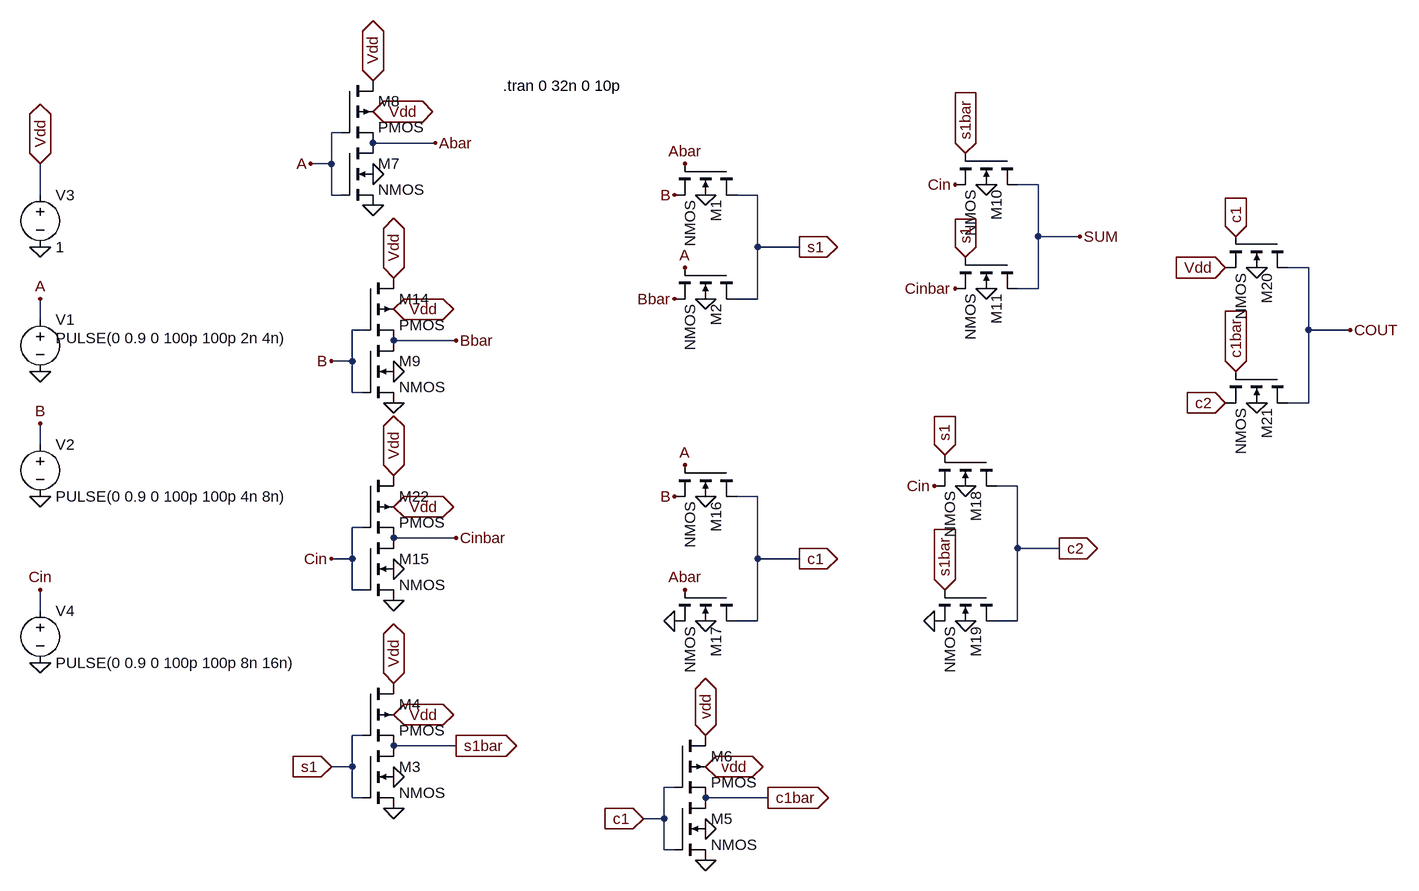
[diagram p0: schematic cmospasstran.asc]
cmospasstran.asc, the LTspice schematic file:
Version 4.1
SHEET 1 3336 932
WIRE 160 -368 144 -368
WIRE 304 -352 208 -352
WIRE 144 -320 144 -368
WIRE 144 -320 112 -320
WIRE 1232 -288 1200 -288
WIRE -304 -272 -304 -320
WIRE 144 -272 144 -320
WIRE 160 -272 144 -272
WIRE 800 -272 768 -272
WIRE 1232 -208 1232 -288
WIRE 1296 -208 1232 -208
WIRE 800 -192 800 -272
WIRE 864 -192 800 -192
WIRE 1648 -160 1616 -160
WIRE 1232 -128 1232 -208
WIRE 1232 -128 1200 -128
WIRE 800 -112 800 -192
WIRE 800 -112 768 -112
WIRE -304 -80 -304 -112
WIRE 192 -64 176 -64
WIRE 1648 -64 1648 -160
WIRE 1712 -64 1648 -64
WIRE 336 -48 240 -48
WIRE 176 -16 176 -64
WIRE 176 -16 144 -16
WIRE 176 32 176 -16
WIRE 192 32 176 32
WIRE 1648 48 1648 -64
WIRE 1648 48 1616 48
WIRE -304 112 -304 80
WIRE 1200 176 1168 176
WIRE 800 192 768 192
WIRE 192 240 176 240
WIRE 336 256 240 256
WIRE 1200 272 1200 176
WIRE 1264 272 1200 272
WIRE 176 288 176 240
WIRE 176 288 144 288
WIRE 800 288 800 192
WIRE 864 288 800 288
WIRE 176 336 176 288
WIRE 192 336 176 336
WIRE -304 368 -304 336
WIRE 800 384 800 288
WIRE 800 384 768 384
WIRE 1200 384 1200 272
WIRE 1200 384 1168 384
WIRE 192 560 176 560
WIRE 336 576 240 576
WIRE 176 608 176 560
WIRE 176 608 144 608
WIRE 672 640 656 640
WIRE 176 656 176 608
WIRE 192 656 176 656
WIRE 816 656 720 656
WIRE 656 688 656 640
WIRE 656 688 624 688
WIRE 656 736 656 688
WIRE 672 736 656 736
FLAG -304 -112 A
FLAG -304 80 B
FLAG -304 -320 Vdd
IOPIN -304 -320 BiDir
FLAG -304 -192 0
FLAG -304 0 0
FLAG -304 192 0
FLAG -304 448 0
FLAG -304 336 Cin
FLAG 720 -272 0
FLAG 720 -112 0
FLAG 864 -192 s1
IOPIN 864 -192 Out
FLAG 1152 -288 0
FLAG 1152 -128 0
FLAG 1296 -208 SUM
FLAG 144 608 s1
IOPIN 144 608 In
FLAG 1120 -336 s1bar
IOPIN 1120 -336 In
FLAG 1120 -176 s1
IOPIN 1120 -176 In
FLAG 672 384 0
FLAG 864 288 c1
IOPIN 864 288 Out
FLAG 720 384 0
FLAG 1088 128 s1
IOPIN 1088 128 In
FLAG 1072 384 0
FLAG 1120 384 0
FLAG 1264 272 c2
IOPIN 1264 272 Out
FLAG 1088 336 s1bar
IOPIN 1088 336 In
FLAG 1568 48 0
FLAG 1712 -64 COUT
FLAG 1120 176 0
FLAG 720 192 0
FLAG 1568 -160 0
FLAG 1536 -208 c1
IOPIN 1536 -208 In
FLAG 1520 48 c2
IOPIN 1520 48 In
FLAG 1520 -160 Vdd
IOPIN 1520 -160 In
FLAG 1536 0 c1bar
IOPIN 1536 0 In
FLAG 304 -352 Abar
FLAG 336 -48 Bbar
FLAG 336 576 s1bar
IOPIN 336 576 Out
FLAG 208 -448 Vdd
IOPIN 208 -448 BiDir
FLAG 208 -400 Vdd
IOPIN 208 -400 BiDir
FLAG 208 -304 0
FLAG 208 -256 0
FLAG 240 -144 Vdd
IOPIN 240 -144 BiDir
FLAG 240 -96 Vdd
IOPIN 240 -96 BiDir
FLAG 240 0 0
FLAG 240 48 0
FLAG 240 160 Vdd
IOPIN 240 160 BiDir
FLAG 240 208 Vdd
IOPIN 240 208 BiDir
FLAG 240 304 0
FLAG 240 352 0
FLAG 336 256 Cinbar
FLAG 240 480 Vdd
IOPIN 240 480 BiDir
FLAG 240 528 Vdd
IOPIN 240 528 BiDir
FLAG 240 624 0
FLAG 240 672 0
FLAG 112 -320 A
FLAG 144 -16 B
FLAG 144 288 Cin
FLAG 672 -272 B
FLAG 688 -320 Abar
FLAG 672 -112 Bbar
FLAG 688 -160 A
FLAG 688 144 A
FLAG 672 192 B
FLAG 688 336 Abar
FLAG 1072 176 Cin
FLAG 1104 -288 Cin
FLAG 1104 -128 Cinbar
FLAG 720 560 vdd
IOPIN 720 560 BiDir
FLAG 720 608 vdd
IOPIN 720 608 BiDir
FLAG 720 704 0
FLAG 720 752 0
FLAG 624 688 c1
IOPIN 624 688 In
FLAG 816 656 c1bar
IOPIN 816 656 Out
SYMBOL voltage -304 -96 R0
WINDOW 3 24 44 Left 2
WINDOW 123 0 0 Left 0
WINDOW 39 0 0 Left 0
SYMATTR Value PULSE(0 0.9 0 100p 100p 2n 4n)
SYMATTR InstName V1
SYMBOL voltage -304 96 R0
WINDOW 123 0 0 Left 0
WINDOW 39 0 0 Left 0
SYMATTR InstName V2
SYMATTR Value PULSE(0 0.9 0 100p 100p 4n 8n)
SYMBOL voltage -304 -288 R0
WINDOW 123 0 0 Left 0
WINDOW 39 0 0 Left 0
SYMATTR InstName V3
SYMATTR Value 1
SYMBOL voltage -304 352 R0
WINDOW 123 0 0 Left 0
WINDOW 39 0 0 Left 0
SYMATTR InstName V4
SYMATTR Value PULSE(0 0.9 0 100p 100p 8n 16n)
SYMBOL nmos4 768 -320 R90
SYMATTR InstName M1
SYMATTR Value2 l=32n w=96n
SYMBOL nmos4 768 -160 R90
SYMATTR InstName M2
SYMATTR Value2 l=32n w=96n
SYMBOL nmos4 1200 -336 R90
SYMATTR InstName M10
SYMATTR Value2 l=32n w=96n
SYMBOL nmos4 1200 -176 R90
SYMATTR InstName M11
SYMATTR Value2 l=32n w=96n
SYMBOL nmos4 768 144 R90
SYMATTR InstName M16
SYMATTR Value2 l=32n w=96n
SYMBOL nmos4 768 336 R90
SYMATTR InstName M17
SYMATTR Value2 l=32n w=96n
SYMBOL nmos4 1168 128 R90
SYMATTR InstName M18
SYMATTR Value2 l=32n w=96n
SYMBOL nmos4 1168 336 R90
SYMATTR InstName M19
SYMATTR Value2 l=32n w=96n
SYMBOL nmos4 1616 -208 R90
SYMATTR InstName M20
SYMATTR Value2 l=32n w=96n
SYMBOL nmos4 1616 0 R90
SYMATTR InstName M21
SYMATTR Value2 l=32n w=96n
SYMBOL nmos4 160 -352 R0
SYMATTR InstName M7
SYMATTR Value2 l=32n w=96n
SYMBOL pmos4 160 -448 R0
SYMATTR InstName M8
SYMATTR Value2 l=32n w=96n
SYMBOL nmos4 192 -48 R0
SYMATTR InstName M9
SYMATTR Value2 l=32n w=96n
SYMBOL pmos4 192 -144 R0
SYMATTR InstName M14
SYMATTR Value2 l=32n w=96n
SYMBOL nmos4 192 256 R0
SYMATTR InstName M15
SYMATTR Value2 l=32n w=96n
SYMBOL pmos4 192 160 R0
SYMATTR InstName M22
SYMATTR Value2 l=32n w=96n
SYMBOL nmos4 192 576 R0
SYMATTR InstName M3
SYMATTR Value2 l=32n w=96n
SYMBOL pmos4 192 480 R0
SYMATTR InstName M4
SYMATTR Value2 l=32n w=96n
SYMBOL nmos4 672 656 R0
SYMATTR InstName M5
SYMATTR Value2 l=32n w=96n
SYMBOL pmos4 672 560 R0
SYMATTR InstName M6
SYMATTR Value2 l=32n w=96n
TEXT 408 -440 Left 2 !.tran 0 32n 0 10p

The netlist it stands for:
* cmospasstran.asc
V1 A 0 PULSE(0 0.9 0 100p 100p 2n 4n)
V2 B 0 PULSE(0 0.9 0 100p 100p 4n 8n)
V3 Vdd 0 1
V4 Cin 0 PULSE(0 0.9 0 100p 100p 8n 16n)
M1 s1 Abar B 0 NMOS l=32n w=96n
M2 s1 A Bbar 0 NMOS l=32n w=96n
M10 SUM s1bar Cin 0 NMOS l=32n w=96n
M11 SUM s1 Cinbar 0 NMOS l=32n w=96n
M16 c1 A B 0 NMOS l=32n w=96n
M17 c1 Abar 0 0 NMOS l=32n w=96n
M18 c2 s1 Cin 0 NMOS l=32n w=96n
M19 c2 s1bar 0 0 NMOS l=32n w=96n
M20 COUT c1 Vdd 0 NMOS l=32n w=96n
M21 COUT c1bar c2 0 NMOS l=32n w=96n
M7 Abar A 0 0 NMOS l=32n w=96n
M8 Vdd A Abar Vdd PMOS l=32n w=96n
M9 Bbar B 0 0 NMOS l=32n w=96n
M14 Vdd B Bbar Vdd PMOS l=32n w=96n
M15 Cinbar Cin 0 0 NMOS l=32n w=96n
M22 Vdd Cin Cinbar Vdd PMOS l=32n w=96n
M3 s1bar s1 0 0 NMOS l=32n w=96n
M4 Vdd s1 s1bar Vdd PMOS l=32n w=96n
M5 c1bar c1 0 0 NMOS l=32n w=96n
M6 Vdd c1 c1bar Vdd PMOS l=32n w=96n
.model NMOS NMOS
.model PMOS PMOS
.lib standard.mos
.tran 0 32n 0 10p
.backanno
.end

* Results of the author's LTspice run, read from the files saved beside the schematic
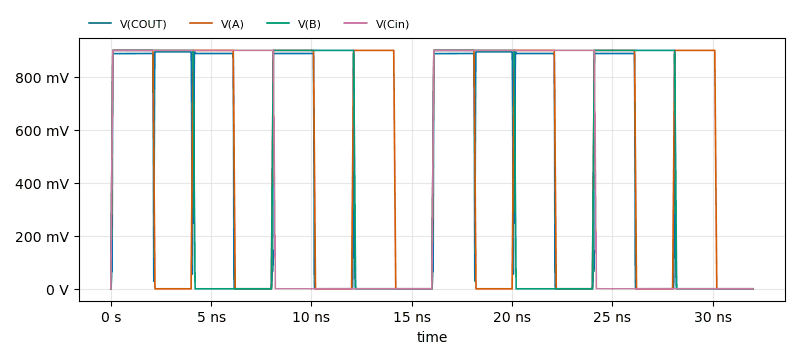
[diagram p1: Transient Analysis of cmospasstran.asc, plotted from the saved traces]
* Transient Analysis, 1 run:
*   V(COUT): min 0 V, max 894.4 mV, average 447.9 mV, rms 628.1 mV, last 0 V
*   V(A): min 0 V, max 900 mV, average 472.5 mV, rms 647 mV, last 0 V
*   V(B): min 0 V, max 900 mV, average 461.3 mV, rms 641.7 mV, last 0 V
*   V(Cin): min 0 V, max 900 mV, average 455.6 mV, rms 639.1 mV, last 0 V